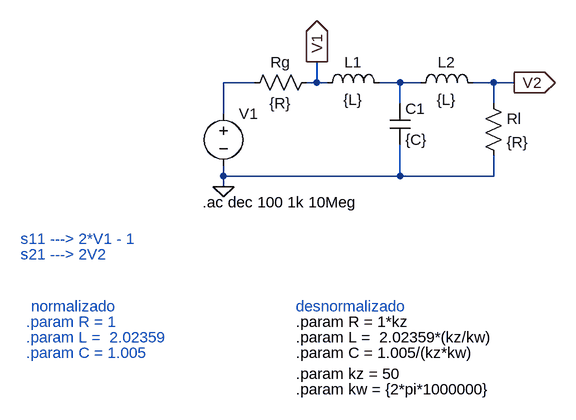
[diagram p0: schematic tarea10.asc]
tarea10.asc, the LTspice schematic file:
Version 4.1
SHEET 1 880 680
WIRE 64 112 16 112
WIRE 160 112 160 80
WIRE 160 112 144 112
WIRE 176 112 160 112
WIRE 288 112 256 112
WIRE 320 112 288 112
WIRE 432 112 400 112
WIRE 464 112 432 112
WIRE 288 144 288 112
WIRE 432 144 432 112
WIRE 16 160 16 112
WIRE 16 256 16 240
WIRE 288 256 288 208
WIRE 288 256 16 256
WIRE 432 256 432 224
WIRE 432 256 288 256
WIRE 16 272 16 256
FLAG 16 272 0
FLAG 160 80 V1
IOPIN 160 80 Out
FLAG 464 112 V2
IOPIN 464 112 Out
SYMBOL voltage 16 144 R0
WINDOW 39 0 0 Left 0
SYMATTR InstName V1
SYMATTR Value ""
SYMATTR Value2 AC 1
SYMBOL res 160 96 R90
WINDOW 0 0 56 VBottom 2
WINDOW 3 32 56 VTop 2
SYMATTR InstName Rg
SYMATTR Value {R}
SYMBOL ind 160 128 R270
WINDOW 0 32 56 VTop 2
WINDOW 3 5 56 VBottom 2
SYMATTR InstName L1
SYMATTR Value {L}
SYMATTR SpiceLine Rser=1m
SYMBOL cap 272 144 R0
SYMATTR InstName C1
SYMATTR Value {C}
SYMBOL ind 304 128 R270
WINDOW 0 32 56 VTop 2
WINDOW 3 5 56 VBottom 2
SYMATTR InstName L2
SYMATTR Value {L}
SYMATTR SpiceLine Rser=1m
SYMBOL res 416 128 R0
SYMATTR InstName Rl
SYMATTR Value {R}
TEXT -16 296 Left 2 !.ac dec 100 1k 10Meg
TEXT -296 352 Left 2 ;s11 ---> 2*V1 - 1
TEXT -296 376 Left 2 ;s21 ---> 2V2
TEXT -288 504 Left 2 ;.param L =  2.02359
TEXT -288 528 Left 2 ;.param C = 1.005
TEXT -288 480 Left 2 ;.param R = 1
TEXT -280 456 Left 2 ;normalizado
TEXT 128 456 Left 2 ;desnormalizado
TEXT 128 504 Left 2 !.param L =  2.02359*(kz/kw)
TEXT 128 528 Left 2 !.param C = 1.005/(kz*kw)
TEXT 128 480 Left 2 !.param R = 1*kz
TEXT 128 560 Left 2 !.param kz = 50
TEXT 128 584 Left 2 !.param kw = {2*pi*1000000}

The netlist it stands for:
* tarea10.asc
V1 N001 0 AC 1
Rg V1 N001 {R}
L1 V1 N002 {L} Rser=1m
C1 N002 0 {C}
L2 N002 V2 {L} Rser=1m
Rl V2 0 {R}
.ac dec 100 1k 10Meg
* s11 ---> 2*V1 - 1
* s21 ---> 2V2
* .param L =  2.02359
* .param C = 1.005
* .param R = 1
* normalizado
* desnormalizado
.param L =  2.02359*(kz/kw)
.param C = 1.005/(kz*kw)
.param R = 1*kz
.param kz = 50
.param kw = {2*pi*1000000}
.backanno
.end